# Altium project Pukk-Sensor-Module-v1.0.PrjPcb (part 6 of 6)
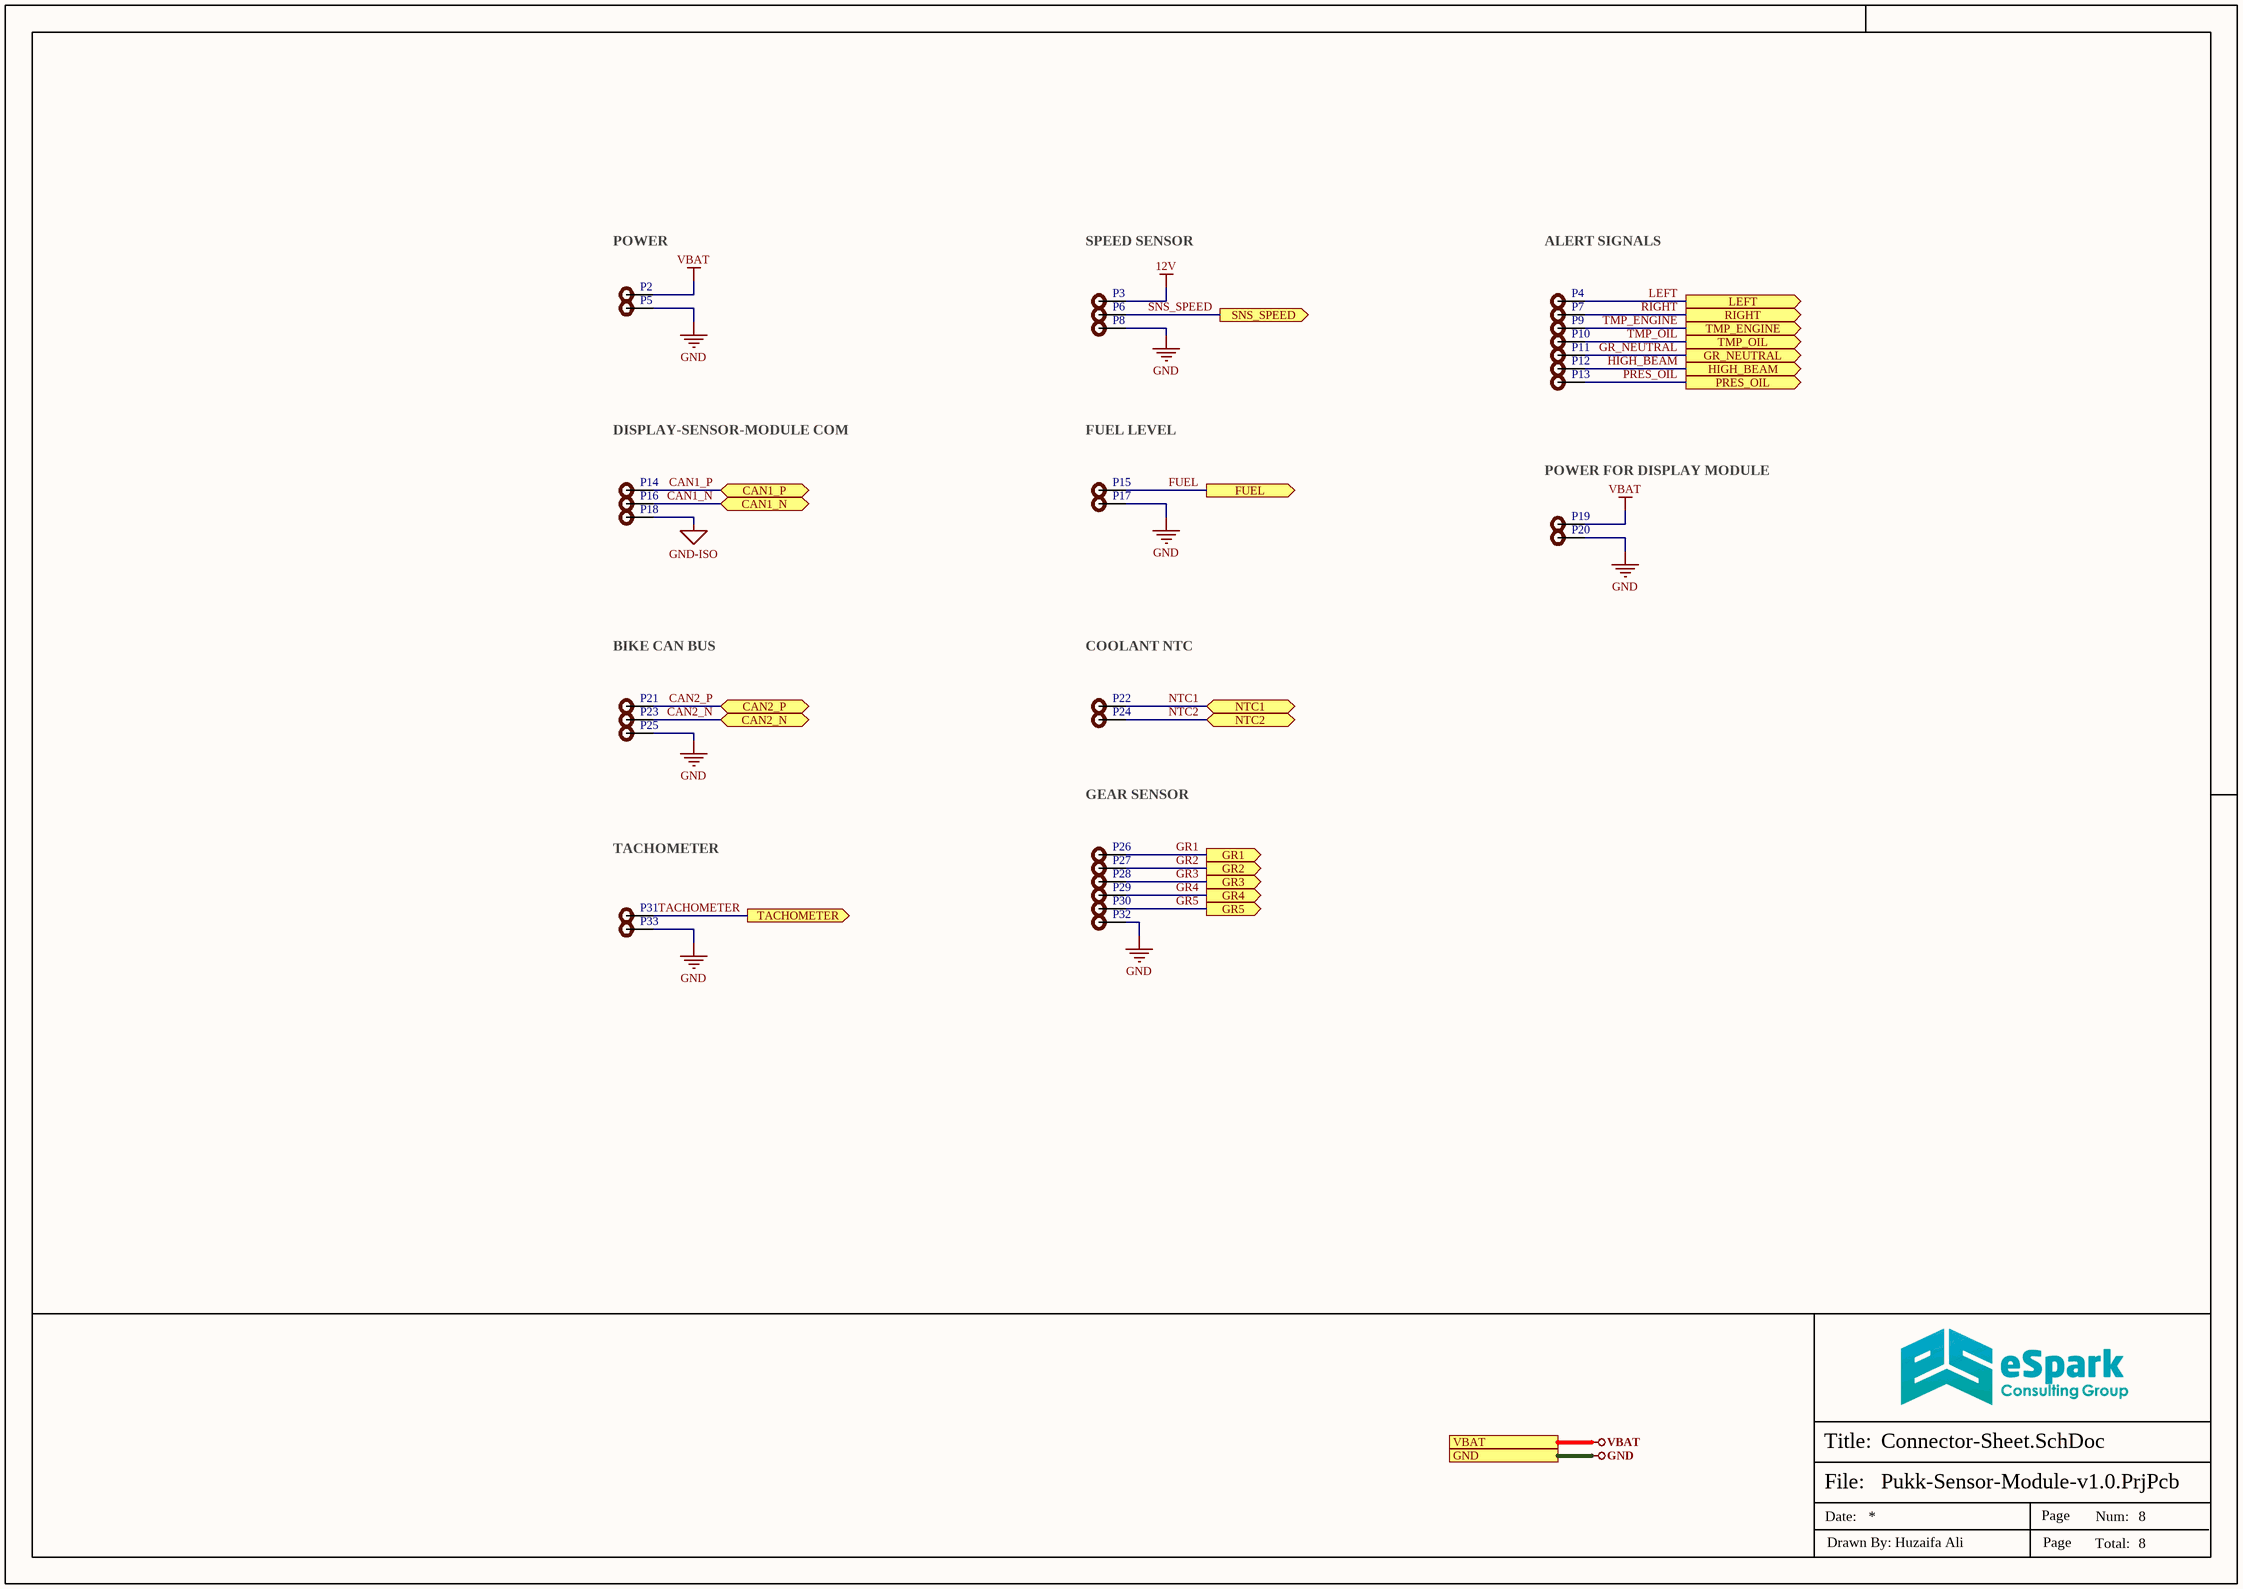
[diagram p9: Connector-Sheet.SchDoc]

## Nets that join several sheets
3V3-ISO: Power-Sheet (D5.2 F4.2 R5.1), Controller-Sheet-1 (14 pins), Controller-Sheet-2 (J2.1 R11.2 SW2.2), CAN-Sheet (7 pins), Sensors-Sheet (23 pins)
5V: Power-Sheet (D4.2 F3.2 R6.1 TP2.1), CAN-Sheet (C33.2 C34.2 U7.11 U7.16), Sensors-Sheet (8 pins)
12V: Power-Sheet (19 pins), Sensors-Sheet (13 pins), Connector-Sheet (P3.1)
GND: Power-Sheet (21 pins), CAN-Sheet (6 pins), Sensors-Sheet (17 pins), Connector-Sheet (7 pins)
GND-ISO: Power-Sheet (10 pins), Controller-Sheet-1 (17 pins), Controller-Sheet-2 (12 pins), USB-Sheet (6 pins), CAN-Sheet (9 pins), Sensors-Sheet (21 pins), Connector-Sheet (P18.1)
VBAT: Power-Sheet (D1.2 J15.1), Connector-Sheet (P2.1 P19.1)
CAN1_N: CAN-Sheet (D26.2 R52.2 R102.1), Connector-Sheet (P16.1)
CAN1_P: CAN-Sheet (D26.1 R50.2 R53.2), Connector-Sheet (P14.1)
CAN1_RXD: Controller-Sheet-2 (R30.2), CAN-Sheet (R51.1)
CAN1_SHDN: Controller-Sheet-2 (R33.2), CAN-Sheet (R54.1)
CAN1_STB: Controller-Sheet-2 (R32.2), CAN-Sheet (R48.1)
CAN1_TXD: Controller-Sheet-2 (R31.2), CAN-Sheet (R49.1)
CAN2_N: CAN-Sheet (D27.2 R59.2 R103.1), Connector-Sheet (P23.1)
CAN2_P: CAN-Sheet (D27.1 R57.2 R60.2), Connector-Sheet (P21.1)
CAN2_RXD: Controller-Sheet-2 (R22.1), CAN-Sheet (R58.1)
CAN2_TXD: Controller-Sheet-2 (R24.1), CAN-Sheet (R56.1)
COOLANT_NTC1: Sensors-Sheet (R84.2), Connector-Sheet (P22.1)
COOLANT_NTC2: Sensors-Sheet (R87.1 U23.4), Connector-Sheet (P24.1)
DI_PC12: Controller-Sheet-2 (R27.2), Sensors-Sheet (R101.2 U27.4)
DI_PD5: Controller-Sheet-2 (R34.2), Sensors-Sheet (R61.1 U9.4)
DI_PD6: Controller-Sheet-2 (R35.2), Sensors-Sheet (R68.1 U12.4)
DI_PD7: Controller-Sheet-2 (R36.2), Sensors-Sheet (R74.1 U16.4)
DI_PD8: Controller-Sheet-2 (R38.2), Sensors-Sheet (R78.1 U19.4)
DI_PD9: Controller-Sheet-2 (R40.2), Sensors-Sheet (R83.1 U21.4)
DI_PE7: Controller-Sheet-2 (R37.1), Sensors-Sheet (R95.1 U25.4)
DI_PE8: Controller-Sheet-2 (R39.1), Sensors-Sheet (R89.1 U24.4)
DI_PE9: Controller-Sheet-2 (R41.1), Sensors-Sheet (R85.1 U22.4)
DI_PE10: Controller-Sheet-2 (R42.1), Sensors-Sheet (R80.1 U20.4)
DI_PE11: Controller-Sheet-2 (R43.1), Sensors-Sheet (R75.1 U17.4)
DI_PE12: Controller-Sheet-2 (R44.1), Sensors-Sheet (R69.1 U13.4)
DI_PE13: Controller-Sheet-2 (R45.1), Sensors-Sheet (R63.1 U10.4)
ENGINE_TEMP: Sensors-Sheet (D19.2), Connector-Sheet (P9.1)
FUEL: Sensors-Sheet (5 pins), Connector-Sheet (P15.1)
GEAR_1: Sensors-Sheet (D13.2), Connector-Sheet (P26.1)
GEAR_2: Sensors-Sheet (D16.2), Connector-Sheet (P27.1)
GEAR_3: Sensors-Sheet (D18.2), Connector-Sheet (P28.1)
GEAR_4: Sensors-Sheet (D20.2), Connector-Sheet (P29.1)
GEAR_5: Sensors-Sheet (D23.2), Connector-Sheet (P30.1)
GR_NEUTRAL: Sensors-Sheet (D24.2), Connector-Sheet (P11.1)
H_BEAM: Sensors-Sheet (R90.1), Connector-Sheet (P12.1)
I2C1_SCL: Controller-Sheet-2 (R17.1), Sensors-Sheet (R99.1 U26.3)
I2C1_SDA: Controller-Sheet-2 (R18.1), Sensors-Sheet (R97.1 U26.2)
LEFT: Sensors-Sheet (R65.1), Connector-Sheet (P4.1)
OIL_PRESSURE: Sensors-Sheet (D25.2), Connector-Sheet (P13.1)
OIL_TEMP: Sensors-Sheet (D22.2), Connector-Sheet (P10.1)
RIGHT: Sensors-Sheet (R71.1), Connector-Sheet (P7.1)
SNS_SPEED: Sensors-Sheet (D17.2), Connector-Sheet (P6.1)
SPEED_SIG: Controller-Sheet-2 (R12.2), Sensors-Sheet (U14.4)
TACH_COIL: Sensors-Sheet (D14.2), Connector-Sheet (P31.1)
TACH_SIG: Controller-Sheet-2 (R16.2), Sensors-Sheet (U8.4)
USB_FS_ID: Controller-Sheet-2 (R19.2), USB-Sheet (R46.1)
USB_FS_N: Controller-Sheet-2 (R20.2), USB-Sheet (U5.1)
USB_FS_P: Controller-Sheet-2 (R21.2), USB-Sheet (U5.3)